# Altium schematic sheet MCU.SchDoc
size A; SheetNumber: 1; SheetTotal: 1
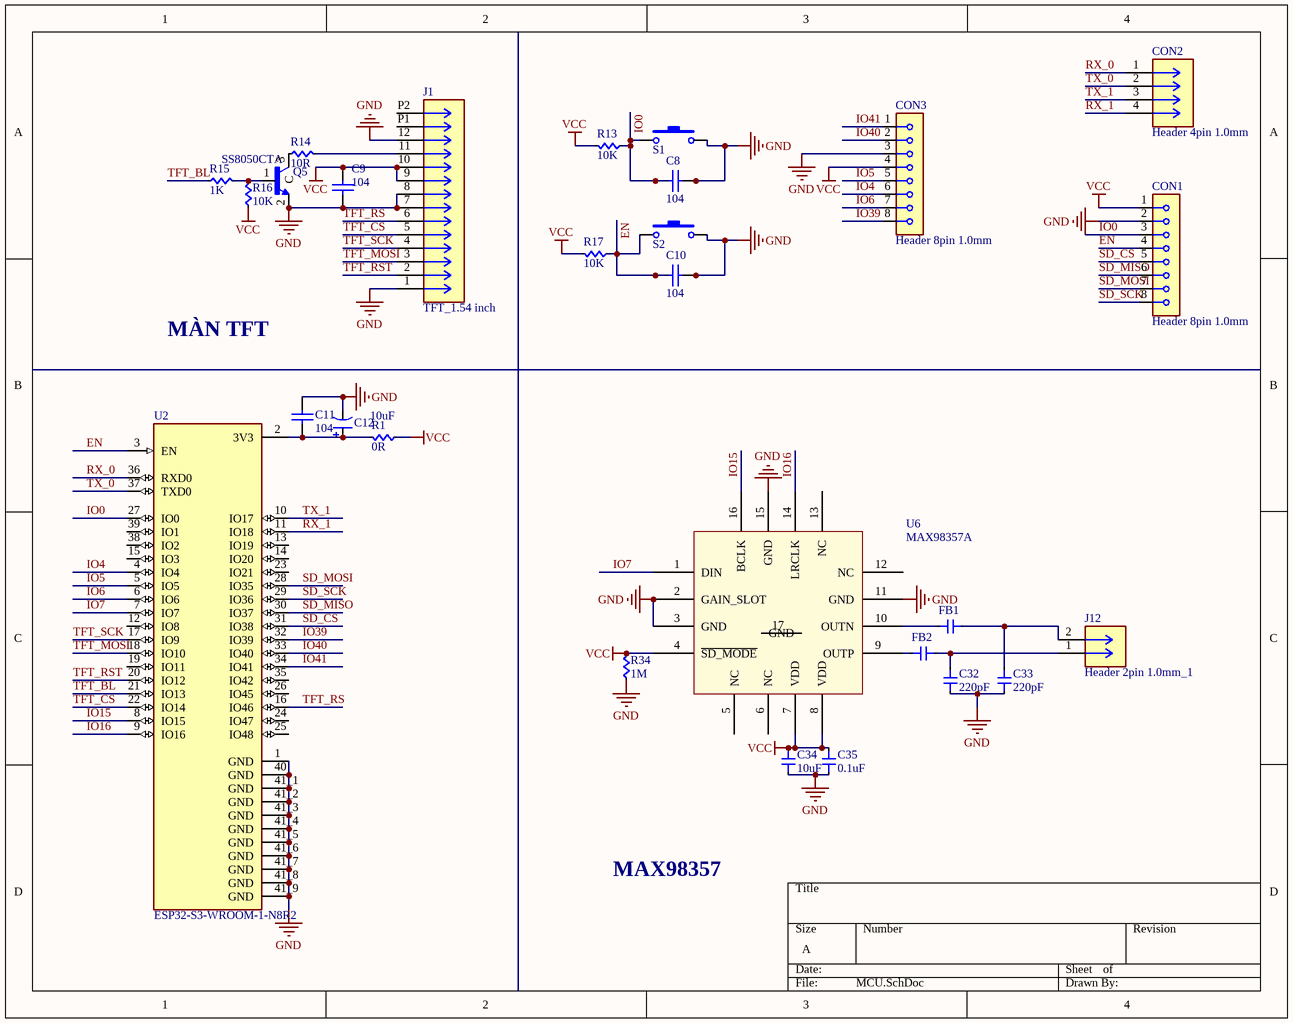
[diagram p0: MCU.SchDoc]

## Parts
C8  104  [tu 0805]
C9  104  [tu 0805]
C10  104  [tu 0805]
C11  104  [tu 0805]
C12  10uF  [CAP-TANTAL-1206(3216)]
C32  220pF  [Cap 0805]
C33  220pF  [Cap 0805]
C34  10uF  [Cap 0805]
C35  0.1uF  [Cap 0805]
CON1  Header 8pin 1.0mm  [JST_BM08B-SRSS-TB(LF)(SN)]
CON2  Header 4pin 1.0mm  [CONN4_BM04B-SRSS_JST - duplicate]
CON3  Header 8pin 1.0mm  [JST_BM08B-SRSS-TB(LF)(SN)]
FB1  ?  [Cap 0805]  (value not drawn)
FB2  ?  [Cap 0805]  (value not drawn)
J1  TFT_1.54 inch  [FPC 12pin 0,5mm]
J12  Header 2pin 1.0mm_1  [CONN2_BM02B-SRSS_JST]
Q5  SS8050CTA  [SS8050 SMD]
R1  0R  [RES 0805]
R13  10K  [RES 0805]
R14  10R  [RES 0805]
R15  1K  [RES 0805]
R16  10K  [RES 0805]
R17  10K  [RES 0805]
R34  1M  [RES 0805]
S1  SW-SMD  [SW_B3U-1000P]  (value not drawn)
S2  SW-SMD  [SW_B3U-1000P]  (value not drawn)
U2  ESP32-S3-WROOM-1-N8R2  [XCVR_ESP32-S3-WROOM-1-N8R2]
U6  MAX98357A  [QFN16N-3X3]

## Nets
GND: C8.1 C9.2 C10.1 C11.2 C12.2(Cathode) C32.2 C33.2 C34.2 C35.2 CON1.2 CON3.3 J1.1 J1.7 J1.8 J1.12 Q5.2(E) R34.1 S1.2 S2.2 U2.1(GND) U2.40(GND) U2.41_1(GND) U2.41_2(GND) U2.41_3(GND) U2.41_4(GND) U2.41_5(GND) U2.41_6(GND) U2.41_7(GND) U2.41_8(GND) U2.41_9(GND) U6.2(GAIN_SLOT) U6.3(GND) U6.11(GND) U6.15(GND)
VCC: C9.1 C34.1 C35.1 CON1.1 CON3.4 J1.9 J1.10 R1.1 R13.2 R16.1 R17.2 R34.2 U6.4(~{SD_MODE}) U6.7(VDD) U6.8(VDD)
EN: C10.2 CON1.4 R17.1 S2.1 U2.3(EN)
IO0: C8.2 CON1.3 R13.1 S1.1 U2.27(IO0)
IO4: CON3.6 U2.4(IO4)
IO5: CON3.5 U2.5(IO5)
IO6: CON3.7 U2.6(IO6)
IO7: U2.7(IO7) U6.1(DIN)
IO15: U2.8(IO15) U6.16(BCLK)
IO16: U2.9(IO16) U6.14(LRCLK)
IO39: CON3.8 U2.32(IO39)
IO40: CON3.2 U2.33(IO40)
IO41: CON3.1 U2.34(IO41)
RX_0: CON2.1 U2.36(RXD0)
RX_1: CON2.4 U2.11(IO18)
SD_CS: CON1.5 U2.31(IO38)
SD_MISO: CON1.6 U2.30(IO37)
SD_MOSI: CON1.7 U2.28(IO35)
SD_SCK: CON1.8 U2.29(IO36)
TFT_BL: R15.1 U2.21(IO13)
TFT_CS: J1.5 U2.22(IO14)
TFT_MOSI: J1.3 U2.18(IO10)
TFT_RS: J1.6 U2.16(IO46)
TFT_RST: J1.2 U2.20(IO12)
TFT_SCK: J1.4 U2.17(IO9)
TX_0: CON2.2 U2.37(TXD0)
TX_1: CON2.3 U2.10(IO17)
NetC11_1: C11.1 C12.1(Anode) R1.2 U2.2(3V3)
NetC32_1: C32.1 FB2.1 J12.1
NetC33_1: C33.1 FB1.1 J12.2
NetFB1_2: FB1.2 U6.10(OUTN)
NetFB2_2: FB2.2 U6.9(OUTP)
NetJ1_11: J1.11 R14.2
NetQ5_1: Q5.1(B) R15.2 R16.2
NetQ5_3: Q5.3(C) R14.1

Not connected (* = marked no-connect by the designer): J1 P1 P2; U2 12(IO8) 13(IO19) 14(IO20) 15(IO3) 19(IO11) 23(IO21) 24(IO47) 25(IO48) 26(IO45) 35(IO42) 38(IO2) 39(IO1); U6 5(NC) 6(NC) 12(NC) 13(NC) 17(GND)

## Notes on the sheet
- MÀN TFT
- MAX98357

## Library data of the parts
C8-C11 = Tu 0805 104 50V 10%: Dán; Don_Vi: Con; So_Chan: 2; Ten_Linh_Kien: Tụ 0805 104-100nF 10% 50V; Ma_Hang: MH004551; Chung_Loai: Dán; Kieu_Chan: *
C12 = CAP TANTAL: CASE-____-18(mm) Tantalum Capacitors
C32-C35 = Cap 0805: Capacitor SMD 0805
CON1 CON3 = Header 8pin 1.0mm: SH Series 8 Position 1 mm Pitch Surface Mount Side Entry Shrouded Header; MF: {'manufacturer': u'JST Sales America Inc.'}; MP: SM08B-SRSS-TB; Package: None; Price: None; Value: *; Availability: Unavailable
CON2 = Header 4pin 1.0mm: Connector Header Surface Mount, Right Angle 4 position 0.039 (1.00mm); MF: JST Sales; MP: SM04B-SRSS-TB; SnapEDA_Link: https://www.snapeda.com/parts/SM04B-SRSS-TB/JST/view-part/?ref=snap; Package: None; Value: *; Check_prices: https://www.snapeda.com/parts/SM04B-SRSS-TB/JST/view-part/?ref=eda
FB1 FB2 = Cap 0805: errite Bead   0603 MMZ1608B121C - 120 Ohm @ 100MHz, 600mA, 0.15 Ohm DC Resistance - Digikey: 445-2164-1-ND  BK1608HW121-T - 120 Ohm, 600mA Ferrite Chip - Digikey: 587-1876-2-ND       0805 HZ0805B272R-10 - 2.7K Ohm @ 100MHz, 200mA, 0.8 Ohm DC Resistance - Digikey: 240-2504-1-ND (see also Murata BLM21BD272SN1L)  MMZ2012Y152B - 1.5K Ohm @ 100MHz, 500mA, 0.4 Ohm DC Resistance - Digikey: 445-1560-1-ND - Mainly for high frequency (80-400MHz)  MMZ2012R102A - 1K Ohm @ 100MHz, 500mA, 0.3 Ohm DC Resistance - Digikey: 445-1555-2-ND - More general purpose (10-200MHz)
J1 = FPC 12pin: FPC 12pin 0,5mm; MF: {'manufacturer': u'Molex'}; MP: 5034801200; Package: None; Price: None; Value: *; Availability: Unavailable
J12 = Header 2pin 1.0mm_1: Connector Header Surface Mount, Right Angle 4 position 0.039 (1.00mm); MF: JST Sales; MP: SM04B-SRSS-TB; SnapEDA_Link: https://www.snapeda.com/parts/SM04B-SRSS-TB/JST/view-part/?ref=snap; Package: None; Value: *; Check_prices: https://www.snapeda.com/parts/SM04B-SRSS-TB/JST/view-part/?ref=eda
R1 R14 R15 R34 = RES 0805: RES SMD 0805; Manufacturer: Vishay Dale; Manufacturer Part Number: CRCW040210K0FKED; Resistance (Ohms): 10k; Tolerance: ±1%; Power (Watts): 0.063W, 1/16W; Temperature Coefficient: ±100ppm/°C; Supplier 1: Digi-Key; RoHS: RoHS Compliant; Category: Resistors; Stock 1: 2392462; Pricing 1: 10=0.083, 50=0.0444, 200=0.0255, 1000=0.0174 (USD); Packaging: Cut Tape (CT); Composition: Thick Film; Features: Automotive AEC-Q200; Operating Temperature: -55°C ~ 155°C; Package / Case: 0402 (1005 Metric); Supplier Device Package: 0402 (1005 Metric); Size / Dimension: 0.039" L x 0.020" W (1.00mm x 0.50mm); Height: 0.016" (0.40mm); Number of Terminations: 2; ComponentLink1URL: http://www.vishay.com/docs/20035/dcrcwe3.pdf; ComponentLink1Description: http://www.vishay.com/docs/20035/dcrcwe3.pdf; Supplier Part Number 1: 541-10.0KLCT-ND
R13 R16 R17 = RES 0805: RES SMD 0805; Manufacturer: Vishay Dale; Manufacturer Part Number: CRCW040210K0FKED; Tolerance: ±1%; Power (Watts): 0.063W, 1/16W; Temperature Coefficient: ±100ppm/°C; Supplier 1: Digi-Key; RoHS: RoHS Compliant; Category: Resistors; Stock 1: 2392462; Pricing 1: 10=0.083, 50=0.0444, 200=0.0255, 1000=0.0174 (USD); Packaging: Cut Tape (CT); Resistance (Ohms): 10k; Composition: Thick Film; Features: Automotive AEC-Q200; Operating Temperature: -55°C ~ 155°C; Package / Case: 0402 (1005 Metric); Supplier Device Package: 0402 (1005 Metric); Size / Dimension: 0.039" L x 0.020" W (1.00mm x 0.50mm); Height: 0.016" (0.40mm); Number of Terminations: 2; ComponentLink1URL: http://www.vishay.com/docs/20035/dcrcwe3.pdf; ComponentLink1Description: http://www.vishay.com/docs/20035/dcrcwe3.pdf; Supplier Part Number 1: 541-10.0KLCT-ND
S1 S2 = SW-SMD: Switch; Published: 24-Mar-1999; LatestRevisionDate: 17-Jul-2002; LatestRevisionNote: Re-released for DXP Platform.; PackageReference: SPST-2; Publisher: Altium Limited
U2 = ESP32-S3-WROOM-1-N8R2: WiFi 802.11a/b/g/n, Bluetooth v5.0 Transceiver Module 2.4GHz Antenna Not Included -; MF: Espressif Systems; Package: - Espressif Systems; Price: None; Check_prices: https://www.snapeda.com/parts/ESP32-S3-WROOM-1-N8R2/Espressif+Systems/view-part/?ref=eda; Value: *; SnapEDA_Link: https://www.snapeda.com/parts/ESP32-S3-WROOM-1-N8R2/Espressif+Systems/view-part/?ref=snap; MP: ESP32-S3-WROOM-1-N8R2; Availability: In Stock; Purchase-URL: https://pricing.snapeda.com/search?q=ESP32-S3-WROOM-1-N8R2&ref=eda